# Altium schematic sheet ADAU_POWER.SchDoc
size A; SheetNumber: 9; SheetTotal: 9
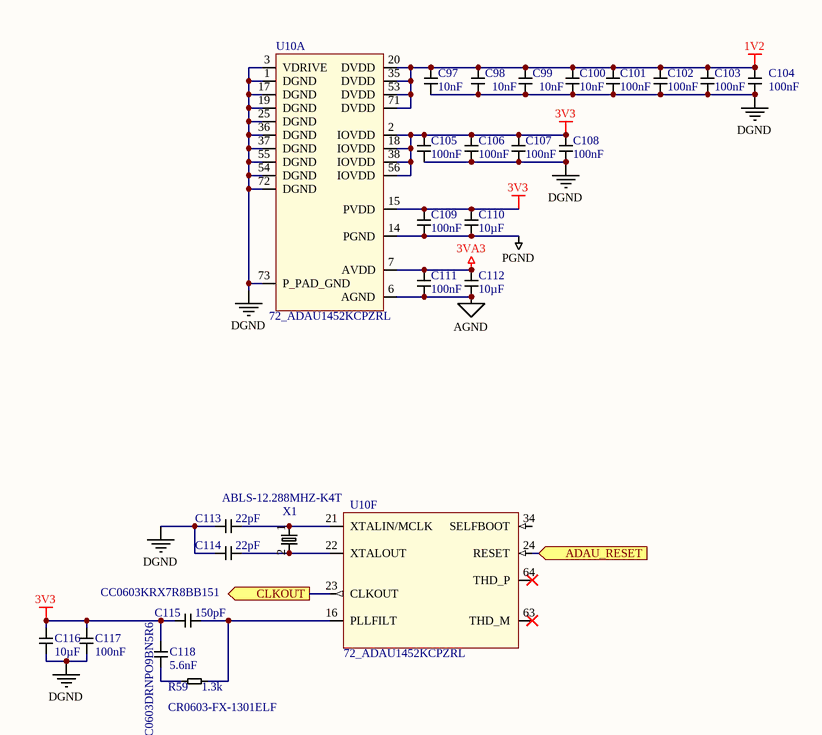
[diagram p0: ADAU_POWER.SchDoc]

## Parts
C97  10nF  [0603_SMD_CAP]
C98  10nF  [0603_SMD_CAP]
C99  10nF  [0603_SMD_CAP]
C100  10nF  [0603_SMD_CAP]
C101  100nF  [0603_SMD_CAP]
C102  100nF  [0603_SMD_CAP]
C103  100nF  [0603_SMD_CAP]
C104  100nF  [0603_SMD_CAP]
C105  100nF  [0603_SMD_CAP]
C106  100nF  [0603_SMD_CAP]
C107  100nF  [0603_SMD_CAP]
C108  100nF  [0603_SMD_CAP]
C109  100nF  [0603_SMD_CAP]
C110  10µF  [0603_SMD_CAP]
C111  100nF  [0603_SMD_CAP]
C112  10µF  [0603_SMD_CAP]
C113  22pF  [0603_SMD_CAP]
C114  22pF  [0603_SMD_CAP]
C115  150pF  type: CC0603KRX7R8BB151  [0603_SMD_CAP]
C116  10µF  [0603_SMD_CAP]
C117  100nF  [0603_SMD_CAP]
C118  5.6nF  type: CC0603DRNPO9BN5R6  [0603_SMD_CAP]
R59  1.3k  type: CR0603-FX-1301ELF  [0603_SMD_PACKAGE]
U10  72_ADAU1452KCPZRL  [QFN-72_ADAU1452KCPZRL]  (parts A,F of 7)
X1  type: ABLS-12.288MHZ-K4T  [HC-49S_SMD_XTAL]  (hidden comment: 2-pin xtal)

## Ports
ADAU_RESET (in, see TOP_SHEET[1D], PERIPHERAL_SHEET[1A]), CLKOUT (out, see TOP_SHEET[2D])

## Nets
1V2: C97.1 C98.1 C99.1 C100.1 C101.1 C102.1 C103.1 C104.1 U10.20(DVDD) U10.35(DVDD) U10.53(DVDD) U10.71(DVDD)
3V3: C105.1 C106.2 C107.2 C108.2 C109.1 C110.1 C115.2 C116.2 C117.2 C118.2 U10.2(IOVDD) U10.15(PVDD) U10.18(IOVDD) U10.38(IOVDD) U10.56(IOVDD)
3VA3: C111.2 C112.1 U10.7(AVDD)
AGND: C111.1 C112.2 U10.6(AGND)
DGND: C97.2 C98.2 C99.2 C100.2 C101.2 C102.2 C103.2 C104.2 C105.2 C106.1 C107.1 C108.1 C113.1 C114.1 C116.1 C117.1 U10.1(DGND) U10.3(VDRIVE) U10.17(DGND) U10.19(DGND) U10.25(DGND) U10.36(DGND) U10.37(DGND) U10.54(DGND) U10.55(DGND) U10.72(DGND) U10.73(P_PAD_GND)
PGND: C109.2 C110.2 U10.14(PGND)
ADAU_RESET: U10.24(RESET) ; port ADAU_RESET
CLKOUT: U10.23(CLKOUT) ; port CLKOUT
NetC113_2: C113.2 U10.21(XTALIN/MCLK) X1.1
NetC114_2: C114.2 U10.22(XTALOUT) X1.2
NetC115_1: C115.1 R59.1 U10.16(PLLFILT)
NetC118_1: C118.1 R59.2

Not connected (* = marked no-connect by the designer): U10 34(SELFBOOT) 63(THD_M)* 64(THD_P)*

## Library data of the parts
C97-C118 = ceramic capacator
  C97-C114 C116 C117: type: *
R59 = resistor
U10 = 72_ADAU1452KCPZRL: DSP,4xI2S,I2C,SPI,1.2V-3.6V,16channels, 10 bit resolution, max_clk = 294MHz; Supplier 1: Arrow Electronics; Supplier Part Number 1: ADAU1452KCPZ
X1 = 2-pin xtal: Supplier 1: Avnet; Supplier Part Number 1: ABLS-12.288MHZ-K4T